# Altium schematic sheet Motor_Driver_Sheet2.SchDoc (part 1 of 2)
size 420 x 297 mm; SheetNumber: 14; SheetTotal: 26
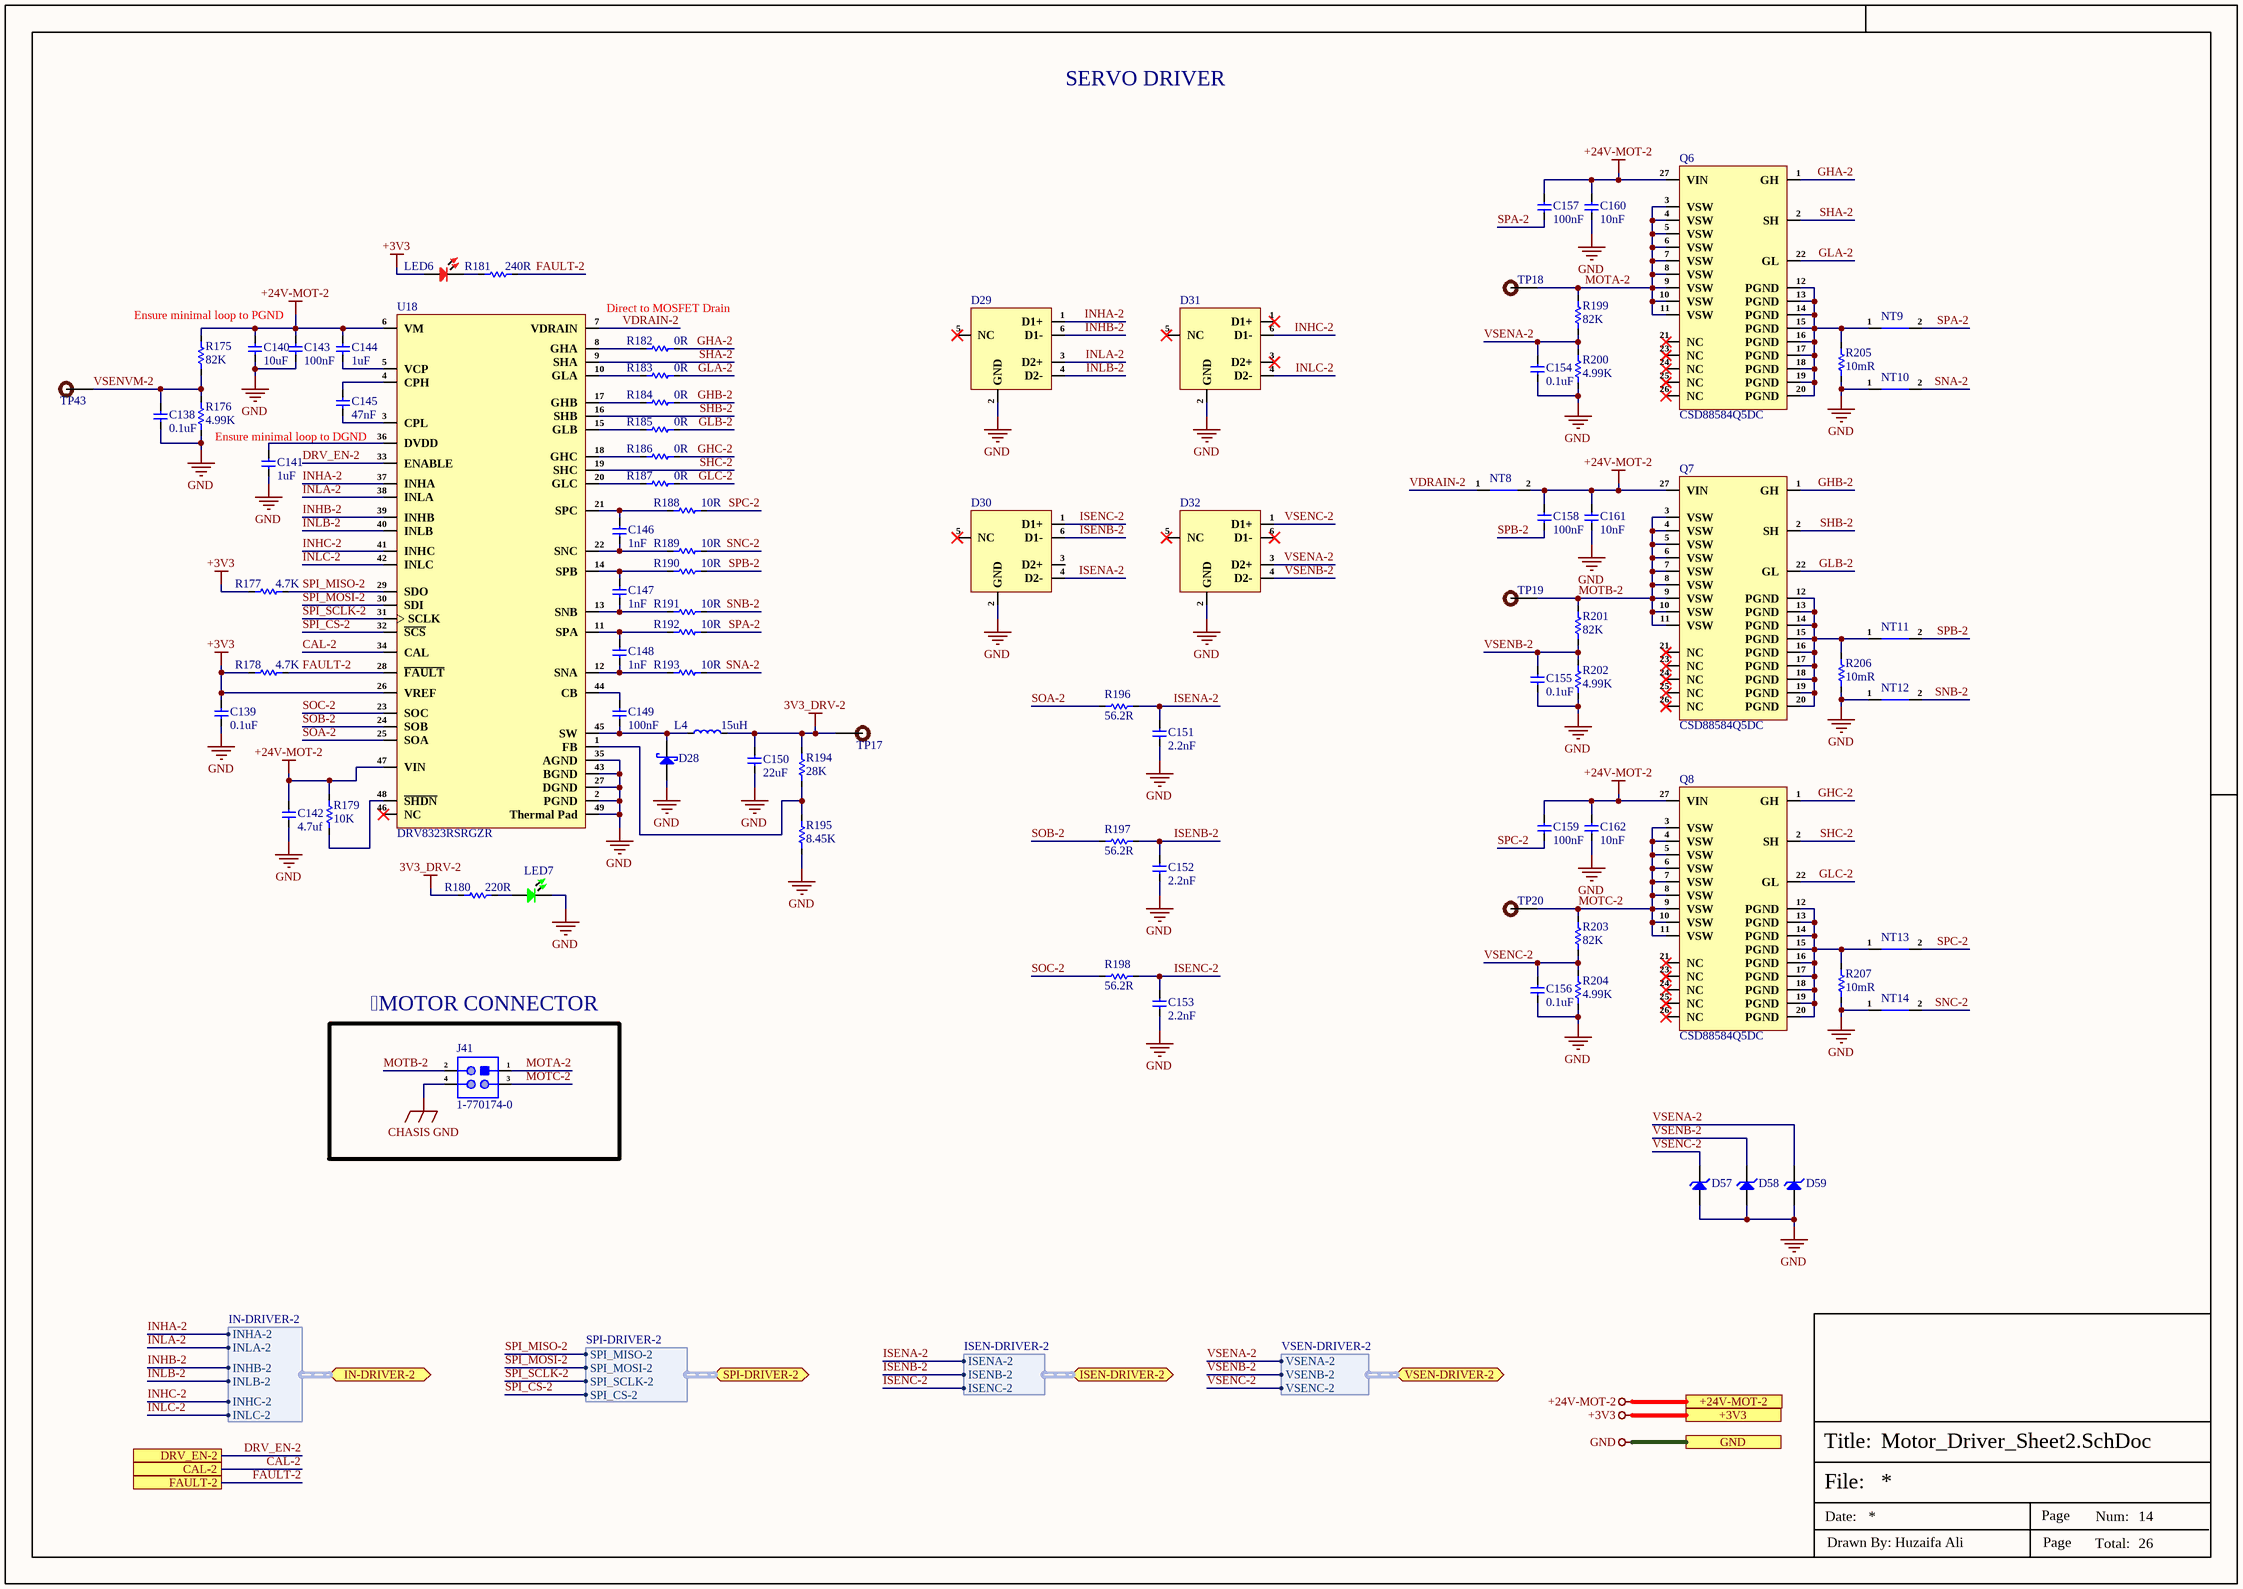
[diagram p0: Motor_Driver_Sheet2.SchDoc]

## Parts
C138  0.1uF  [Cap-0402]
C139  0.1uF  [Cap-0402]
C140  10uF  [Cap-1206]
C141  1uF  [Cap-0603]
C142  4.7uf  [Cap-0805]
C143  100nF  [Cap-0603]
C144  1uF  [Cap-0603]
C145  47nF  [Cap-0402]
C146  1nF  [Cap-0402]
C147  1nF  [Cap-0402]
C148  1nF  [Cap-0402]
C149  100nF  [Cap-0603]
C150  22uF  [Cap-0603]
C151  2.2nF  [Cap-0603]
C152  2.2nF  [Cap-0603]
C153  2.2nF  [Cap-0603]
C154  0.1uF  [Cap-0402]
C155  0.1uF  [Cap-0402]
C156  0.1uF  [Cap-0402]
C157  100nF  [Cap-0603]
C158  100nF  [Cap-0603]
C159  100nF  [Cap-0603]
C160  10nF  [Cap-0402]
C161  10nF  [Cap-0402]
C162  10nF  [Cap-0402]
D28  SS24A  [SMA]  (value not drawn)
D29  TPD4E1U06DCKR  [SOT-363]  (value not drawn)
D30  TPD4E1U06DCKR  [SOT-363]  (value not drawn)
D31  TPD4E1U06DCKR  [SOT-363]  (value not drawn)
D32  TPD4E1U06DCKR  [SOT-363]  (value not drawn)
D57  MM3Z3V3B  [SOD323F]  (value not drawn)
D58  MM3Z3V3B  [SOD323F]  (value not drawn)
D59  MM3Z3V3B  [SOD323F]  (value not drawn)
J41  1-770174-0  [1-770174-0]
L4  15uH  [FEXL0550A-150M]
LED6  RED  [LED-0603]  (value not drawn)
LED7  Emerald  [LED-0603]  (value not drawn)
NT8  Net Tie_SMD  [Net Tie Pad]  (value not drawn)  (net tie, no BOM)
NT9  Net Tie_SMD  [Net Tie Pad]  (value not drawn)  (net tie, no BOM)
NT10  Net Tie_SMD  [Net Tie Pad]  (value not drawn)  (net tie, no BOM)
NT11  Net Tie_SMD  [Net Tie Pad]  (value not drawn)  (net tie, no BOM)
NT12  Net Tie_SMD  [Net Tie Pad]  (value not drawn)  (net tie, no BOM)
NT13  Net Tie_SMD  [Net Tie Pad]  (value not drawn)  (net tie, no BOM)
NT14  Net Tie_SMD  [Net Tie Pad]  (value not drawn)  (net tie, no BOM)
Q6  CSD88584Q5DC  [22-VSON-CLIP (5x6)]
Q7  CSD88584Q5DC  [22-VSON-CLIP (5x6)]
Q8  CSD88584Q5DC  [22-VSON-CLIP (5x6)]
R175  82K  [Res-0603]
R176  4.99K  [Res-0603]
R177  4.7K  [Res-0402]
R178  4.7K  [Res-0402]
R179  10K  [Res-0402]
R180  220R  [Res-0603]
R181  240R  [Res-0402]
R182  0R  [Res-0402]
R183  0R  [Res-0402]
R184  0R  [Res-0402]
R185  0R  [Res-0402]
R186  0R  [Res-0402]
R187  0R  [Res-0402]
R188  10R  [Res-0603]
R189  10R  [Res-0603]
R190  10R  [Res-0603]
R191  10R  [Res-0603]
R192  10R  [Res-0603]
R193  10R  [Res-0603]
R194  28K  [Res-0402]
R195  8.45K  [Res-0402]
R196  56.2R  [Res-0603]
R197  56.2R  [Res-0603]
R198  56.2R  [Res-0603]
R199  82K  [Res-0603]
R200  4.99K  [Res-0603]
R201  82K  [Res-0603]
R202  4.99K  [Res-0603]
R203  82K  [Res-0603]
R204  4.99K  [Res-0603]
R205  10mR  [RES-2512]
R206  10mR  [RES-2512]
R207  10mR  [RES-2512]
TP17  TEST POINT 0.5mm Dia  [Test-point - 0.5mm]  (value not drawn)  (no BOM)
TP18  TEST POINT 0.5mm Dia  [Test-point - 0.5mm]  (value not drawn)  (no BOM)
TP19  TEST POINT 0.5mm Dia  [Test-point - 0.5mm]  (value not drawn)  (no BOM)
TP20  TEST POINT 0.5mm Dia  [Test-point - 0.5mm]  (value not drawn)  (no BOM)
TP43  TEST POINT 0.5mm Dia  [Test-point - 0.5mm]  (value not drawn)  (no BOM)
U18  DRV8323RSRGZR  [48-VQFN (7x7)]

## Ports
+3V3 (see Servo2[2A], CAN_Sheet[4D], Controller_Sheet[5D], DIO_1[5D], DIO_2[5D], DIO_3[5D], DIO_4[5D], Encoder_Sheet1[5D], Encoder_Sheet2[4D], Encoder_Sheet3[4D], Encoder_Sheet4[5D], EtherCAT_Sheet[5D], Motor_Driver_Sheet1[5D], Motor_Driver_Sheet3[5D], Motor_Driver_Sheet4[5D], Power_Sheet[5D], RS485_RS232_Sheet[5D], Sec_Controller_Sheet1[5D], Sec_Controller_Sheet2[5D], Sec_Controller_Sheet3[5D], Sec_Controller_Sheet4[5D], Servo1[5D], Servo2[5D], Servo3[5D], Servo4[5D]), +24V-MOT-2 (see Servo2[2A], Power_Sheet[5D], Servo2[5D]), CAL-2 (see Servo2[2A], Sec_Controller_Sheet2[2D]), DRV_EN-2 (see Servo2[2A], Sec_Controller_Sheet2[2D]), FAULT-2 (see Servo2[2B], Sec_Controller_Sheet2[2D]), GND (see Servo2[2A], CAN_Sheet[4D], Controller_Sheet[5D], DIO_1[5D], DIO_2[5D], DIO_3[5D], DIO_4[5D], Encoder_Sheet1[5D], Encoder_Sheet2[4D], Encoder_Sheet3[4D], Encoder_Sheet4[5D], EtherCAT_Sheet[5D], Motor_Driver_Sheet1[5D], Motor_Driver_Sheet3[5D], Motor_Driver_Sheet4[5D], Power_Sheet[5D], RS485_RS232_Sheet[5D], Sec_Controller_Sheet1[5D], Sec_Controller_Sheet2[5D], Sec_Controller_Sheet3[5D], Sec_Controller_Sheet4[5D], Servo1[5D], Servo2[5D], Servo3[5D], Servo4[5D]), IN-DRIVER-2 (bidir, harness IN-DRIVER-2, see Servo2[2B], Sec_Controller_Sheet2[2D]), ISEN-DRIVER-2 (bidir, harness ISEN-DRIVER-2, see Servo2[2B], Sec_Controller_Sheet2[2D]), SPI-DRIVER-2 (bidir, harness SPI-DRIVER-2, see Servo2[2B], Sec_Controller_Sheet2[2D]), VSEN-DRIVER-2 (bidir, harness VSEN-DRIVER-2, see Servo2[2B], Sec_Controller_Sheet2[3C])

## Harnesses
IN-DRIVER-2: INHA-2, INLA-2, INHB-2, INLB-2, INHC-2, INLC-2
SPI-DRIVER-2: SPI_MISO-2, SPI_MOSI-2, SPI_SCLK-2, SPI_CS-2
ISEN-DRIVER-2: ISENA-2, ISENB-2, ISENC-2
VSEN-DRIVER-2: VSENA-2, VSENB-2, VSENC-2

## Nets
3V3_DRV-2: C150.2 L4.2 R180.1 R194.2 TP17.1
+3V3: C139.2 LED6.1 R177.1 R178.1 U18.26(VREF) ; port +3V3
+24V-MOT-2: C140.2 C142.2 C143.2 C144.2 C157.2 C158.2 C159.2 C160.2 C161.2 C162.2 NT8.2 Q6.27(VIN) Q7.27(VIN) Q8.27(VIN) R175.2 R179.1 U18.6(VM) U18.47(VIN) ; port +24V-MOT-2
CHASIS GND: J41.4
GND: C138.1 C139.1 C140.1 C141.1 C142.1 C143.1 C150.1 C151.1 C152.1 C153.1 C154.1 C155.1 C156.1 C160.1 C161.1 C162.1 D28.2(A) D29.2(GND) D30.2(GND) D31.2(GND) D32.2(GND) D57.1(A) D58.1(A) D59.1(A) LED7.2 NT10.1 NT12.1 NT14.1 R176.1 R195.1 R200.1 R202.1 R204.1 R205.1 R206.1 R207.1 U18.2(PGND) U18.27(DGND) U18.35(AGND) U18.43(BGND) U18.49(Thermal_Pad) ; port GND
CAL-2: U18.34(CAL) ; port CAL-2
DRV_EN-2: U18.33(ENABLE) ; port DRV_EN-2
FAULT-2: R178.2 R181.2 U18.28(~{FAULT}) ; port FAULT-2
GHA-2: Q6.1(GH) R182.2
GHB-2: Q7.1(GH) R184.2
GHC-2: Q8.1(GH) R186.2
GLA-2: Q6.22(GL) R183.2
GLB-2: Q7.22(GL) R185.2
GLC-2: Q8.22(GL) R187.2
INHA-2: D29.1(D1+) U18.37(INHA) ; port IN-DRIVER-2.INHA-2
INHB-2: D29.6(D1-) U18.39(INHB) ; port IN-DRIVER-2.INHB-2
INHC-2: D31.6(D1-) U18.41(INHC) ; port IN-DRIVER-2.INHC-2
INLA-2: D29.3(D2+) U18.38(INLA) ; port IN-DRIVER-2.INLA-2
INLB-2: D29.4(D2-) U18.40(INLB) ; port IN-DRIVER-2.INLB-2
INLC-2: D31.4(D2-) U18.42(INLC) ; port IN-DRIVER-2.INLC-2
ISENA-2: C151.2 D30.4(D2-) R196.2 ; port ISEN-DRIVER-2.ISENA-2
ISENB-2: C152.2 D30.6(D1-) R197.2 ; port ISEN-DRIVER-2.ISENB-2
ISENC-2: C153.2 D30.1(D1+) R198.2 ; port ISEN-DRIVER-2.ISENC-2
MOTA-2: J41.1 Q6.3(VSW) Q6.4(VSW) Q6.5(VSW) Q6.6(VSW) Q6.7(VSW) Q6.8(VSW) Q6.9(VSW) Q6.10(VSW) Q6.11(VSW) R199.2 TP18.1
MOTB-2: J41.2 Q7.3(VSW) Q7.4(VSW) Q7.5(VSW) Q7.6(VSW) Q7.7(VSW) Q7.8(VSW) Q7.9(VSW) Q7.10(VSW) Q7.11(VSW) R201.2 TP19.1
MOTC-2: J41.3 Q8.3(VSW) Q8.4(VSW) Q8.5(VSW) Q8.6(VSW) Q8.7(VSW) Q8.8(VSW) Q8.9(VSW) Q8.10(VSW) Q8.11(VSW) R203.2 TP20.1
SHA-2: Q6.2(SH) U18.9(SHA)
SHB-2: Q7.2(SH) U18.16(SHB)
SHC-2: Q8.2(SH) U18.19(SHC)
SNA-2: NT10.2 R193.2
SNB-2: NT12.2 R191.2
SNC-2: NT14.2 R189.2
SOA-2: R196.1 U18.25(SOA)
SOB-2: R197.1 U18.24(SOB)
SOC-2: R198.1 U18.23(SOC)
SPA-2: C157.1 NT9.2 R192.2
SPB-2: C158.1 NT11.2 R190.2
SPC-2: C159.1 NT13.2 R188.2
SPI_CS-2: U18.32(~{SCS}) ; port SPI-DRIVER-2.SPI_CS-2
SPI_MISO-2: R177.2 U18.29(SDO) ; port SPI-DRIVER-2.SPI_MISO-2
SPI_MOSI-2: U18.30(SDI) ; port SPI-DRIVER-2.SPI_MOSI-2
SPI_SCLK-2: U18.31(SCLK) ; port SPI-DRIVER-2.SPI_SCLK-2
VDRAIN-2: NT8.1 U18.7(VDRAIN)
VSENA-2: C154.2 D32.3(D2+) D59.2(K) R199.1 R200.2 ; port VSEN-DRIVER-2.VSENA-2
VSENB-2: C155.2 D32.4(D2-) D58.2(K) R201.1 R202.2 ; port VSEN-DRIVER-2.VSENB-2
VSENC-2: C156.2 D32.1(D1+) D57.2(K) R203.1 R204.2 ; port VSEN-DRIVER-2.VSENC-2
VSENVM-2: C138.2 R175.1 R176.2 TP43.1
NetC141_2: C141.2 U18.36(DVDD)
NetC144_1: C144.1 U18.5(VCP)
NetC145_1: C145.1 U18.3(CPL)
NetC145_2: C145.2 U18.4(CPH)
NetC146_1: C146.1 R189.1 U18.22(SNC)
NetC146_2: C146.2 R188.1 U18.21(SPC)
NetC147_1: C147.1 R191.1 U18.13(SNB)
NetC147_2: C147.2 R190.1 U18.14(SPB)
NetC148_1: C148.1 R193.1 U18.12(SNA)
NetC148_2: C148.2 R192.1 U18.11(SPA)
NetC149_1: C149.1 D28.1(K) L4.1 U18.45(SW)
NetC149_2: C149.2 U18.44(CB)
NetLED6_2: LED6.2 R181.1
NetLED7_1: LED7.1 R180.2
NetNT9_1: NT9.1 Q6.12(PGND) Q6.13(PGND) Q6.14(PGND) Q6.15(PGND) Q6.16(PGND) Q6.17(PGND) Q6.18(PGND) Q6.19(PGND) Q6.20(PGND) R205.2
NetNT11_1: NT11.1 Q7.12(PGND) Q7.13(PGND) Q7.14(PGND) Q7.15(PGND) Q7.16(PGND) Q7.17(PGND) Q7.18(PGND) Q7.19(PGND) Q7.20(PGND) R206.2
NetNT13_1: NT13.1 Q8.12(PGND) Q8.13(PGND) Q8.14(PGND) Q8.15(PGND) Q8.16(PGND) Q8.17(PGND) Q8.18(PGND) Q8.19(PGND) Q8.20(PGND) R207.2
NetR179_2: R179.2 U18.48(~{SHDN})
NetR182_1: R182.1 U18.8(GHA)
NetR183_1: R183.1 U18.10(GLA)
NetR184_1: R184.1 U18.17(GHB)
NetR185_1: R185.1 U18.15(GLB)
NetR186_1: R186.1 U18.18(GHC)
NetR187_1: R187.1 U18.20(GLC)
NetR194_1: R194.1 R195.2 U18.1(FB)

Not connected (* = marked no-connect by the designer): D29 5(NC)*; D30 3(D2+) 5(NC)*; D31 1(D1+)* 3(D2+)* 5(NC)*; D32 5(NC)* 6(D1-)*; Q6 21(NC)* 23(NC)* 24(NC)* 25(NC)* 26(NC)*; Q7 21(NC)* 23(NC)* 24(NC)* 25(NC)* 26(NC)*; Q8 21(NC)* 23(NC)* 24(NC)* 25(NC)* 26(NC)*; U18 46(NC)*

## Notes on the sheet
- SERVO DRIVER
- Ensure minimal loop to PGND
- Direct to MOSFET Drain
- Ensure minimal loop to DGND
- MOTOR CONNECTOR
- File:
- Title:
- Date:
- Page
- Num:
- Total:
- Drawn By: Huzaifa Ali